# Altium schematic sheet AIR_SENSE.SchDoc
size A3; CompanyName: KDS; Organization: KDS; DocumentNumber: 1; Revision: V1I1; SheetNumber: 1; SheetTotal: 6; PageSetup: Record=PageOptions|CenterHorizontal=True|CenterVertical=True|PrintScale=1.07|XCorrection=1.00|YCorrection=1.00|PrintKind=1|BorderSize=5000000|LeftOffset=0|BottomOffset=0|Orientation=2|PaperLength=1000|PaperWidth=1000|Scale=100|PaperSource=7|PrintQuality=600|MediaType=1|DitherType=10|PaperKind=A3|PrintScaleMode=1; ProjectName: KDS C6A816x Module
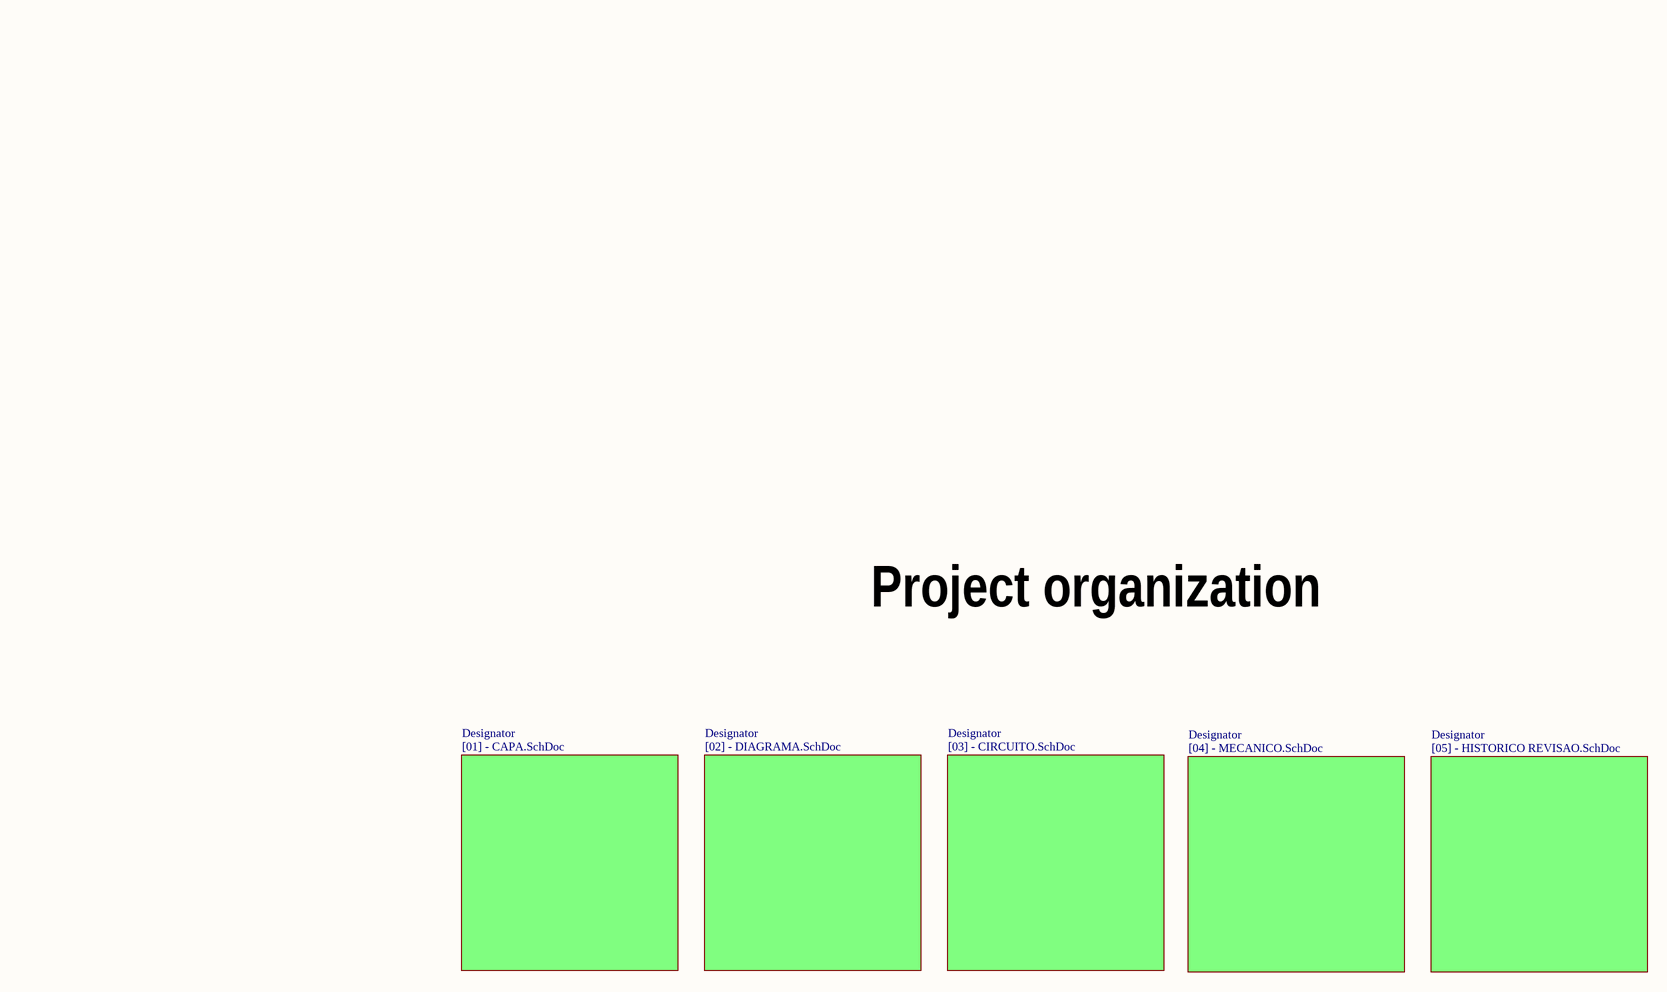
[diagram p0: AIR_SENSE.SchDoc]

## Sub-sheets
Designator = [01] - CAPA.SchDoc: no entries
Designator = [02] - DIAGRAMA.SchDoc: no entries
Designator = [03] - CIRCUITO.SchDoc: no entries
Designator = [04] - MECANICO.SchDoc: no entries
Designator = [05] - HISTORICO REVISAO.SchDoc: no entries

## Notes on the sheet
- Project organization
- Project:
- Revision:
- Engineer:
- Title:
- Pag
- of
- Embedded Things
- Date:
- Hour:
- Variant: